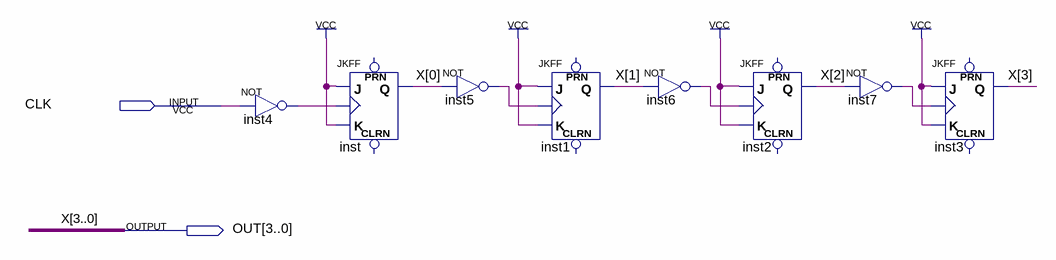
[diagram p0: schematic sheet]
// Quartus schematic Contador_4bits.bdf as structural Verilog: 8 symbols, 2 pins
module Contador_4bits (
  input  CLK,
  output [3:0] OUT
);

  wire inst4_out, inst5_out, inst6_out, inst7_out;

  not inst4 (inst4_out, CLK);
  JKFF inst (.K(1'b1), .J(1'b1), .CLK(inst4_out), .Q(OUT[0]));  // open: PRN, CLRN
  not inst5 (inst5_out, OUT[0]);
  JKFF inst1 (.K(1'b1), .J(1'b1), .CLK(inst5_out), .Q(OUT[1]));  // open: PRN, CLRN
  not inst6 (inst6_out, OUT[1]);
  JKFF inst2 (.K(1'b1), .J(1'b1), .CLK(inst6_out), .Q(OUT[2]));  // open: PRN, CLRN
  not inst7 (inst7_out, OUT[2]);
  JKFF inst3 (.K(1'b1), .J(1'b1), .CLK(inst7_out), .Q(OUT[3]));  // open: PRN, CLRN

  // Other names for the same wires on the sheet: X[3:0] = OUT
endmodule
